# Altium schematic sheet Top_Sheet.SchDoc
size A4; DocumentNumber: 1; SheetNumber: 1; SheetTotal: 28
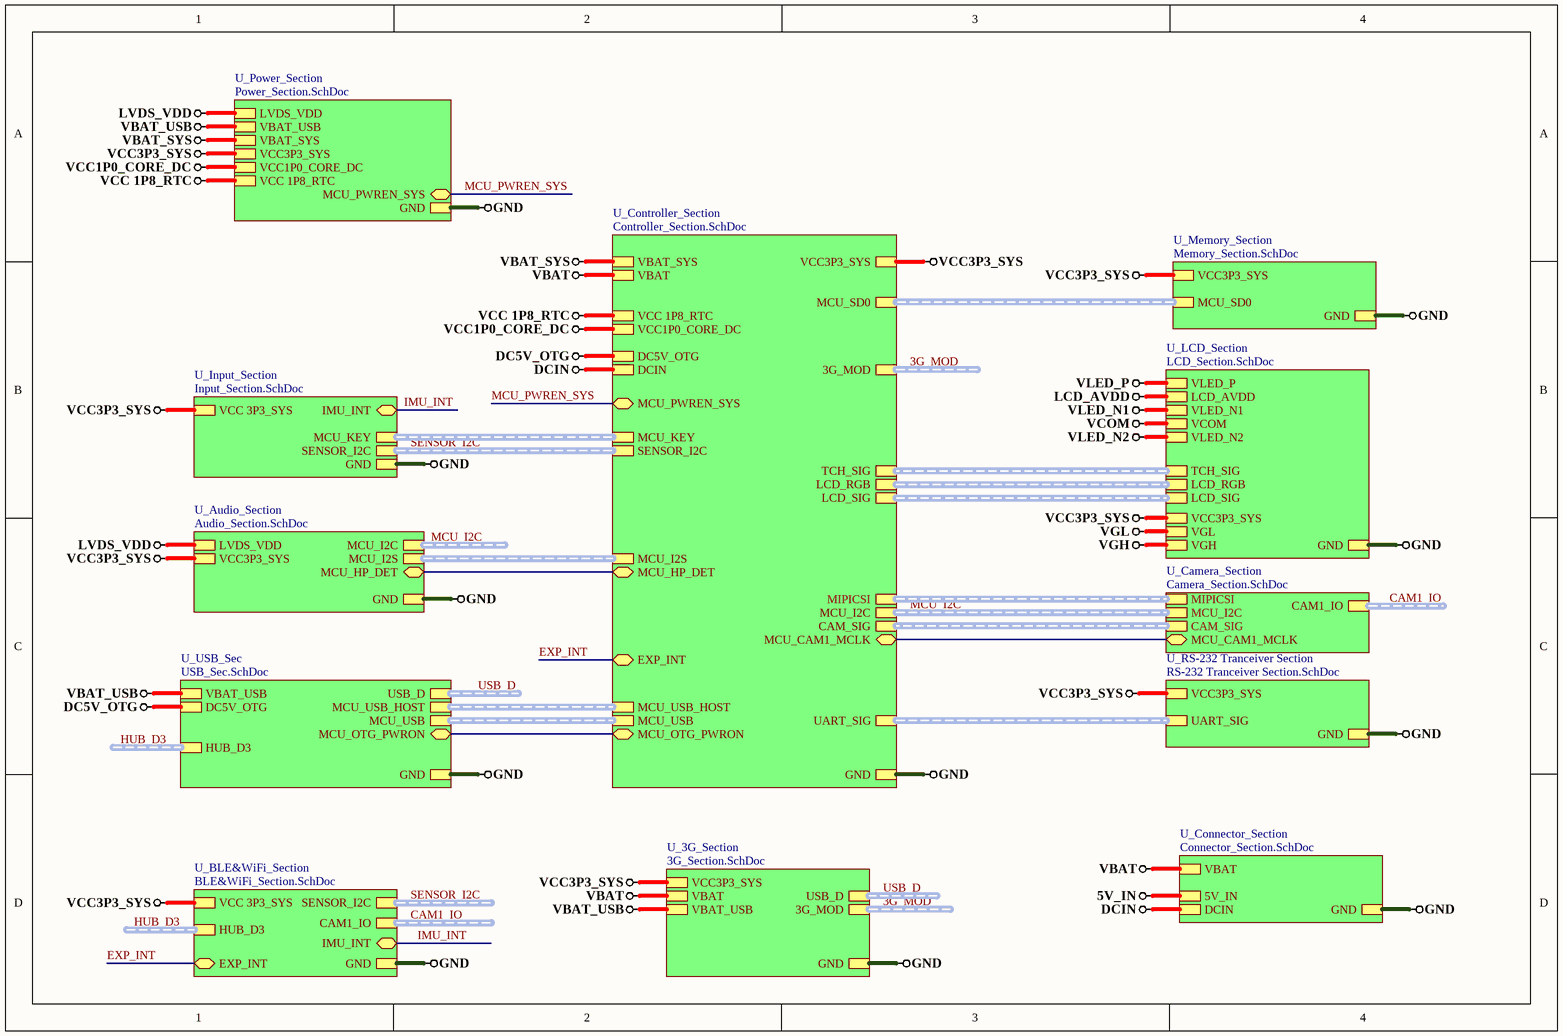
[diagram p0: Top_Sheet.SchDoc]

## Sub-sheets
U_3G_Section = 3G_Section.SchDoc: USB_D (harness USB_D), GND, VCC3P3_SYS, VBAT, VBAT_USB, 3G_MOD (harness 3G_MOD)
U_Audio_Section = Audio_Section.SchDoc: MCU_I2S (harness MCU_I2S), MCU_HP_DET (bidir), LVDS_VDD, VCC3P3_SYS, GND, MCU_I2C (harness MCU_I2C)
U_BLE&WiFi_Section = BLE&WiFi_Section.SchDoc: HUB_D3 (harness HUB_D3), GND, VCC 3P3_SYS, SENSOR_I2C (harness SENSOR_I2C), CAM1_IO (harness CAM1_IO), EXP_INT (bidir), IMU_INT (bidir)
U_Camera_Section = Camera_Section.SchDoc: MCU_I2C (harness MCU_I2C), CAM_SIG (harness CAM_SIG), MCU_CAM1_MCLK (bidir), MIPICSI (harness MIPICSI), CAM1_IO (harness CAM1_IO)
U_Connector_Section = Connector_Section.SchDoc: GND, VBAT, 5V_IN, DCIN
U_Controller_Section = Controller_Section.SchDoc: MCU_HP_DET (bidir), TCH_SIG (harness TCH_SIG), MCU_KEY (harness MCU_KEY), MCU_USB (harness MCU_USB), MCU_SD0 (harness MCU_SD0), MCU_I2C (harness MCU_I2C), MCU_I2S (harness MCU_I2S), CAM_SIG (harness CAM_SIG), MCU_OTG_PWRON (bidir), MCU_CAM1_MCLK (bidir), MCU_USB_HOST (harness MCU_USB_HOST), VCC3P3_SYS, GND, VBAT_SYS, VCC 1P8_RTC, VBAT, VCC1P0_CORE_DC, DC5V_OTG, DCIN, UART_SIG (harness UART_SIG), LCD_RGB (harness LCD_RGB), MCU_PWREN_SYS (bidir), SENSOR_I2C (harness SENSOR_I2C), LCD_SIG (harness LCD_SIG), 3G_MOD (harness 3G_MOD), MIPICSI (harness MIPICSI), EXP_INT (bidir)
U_Input_Section = Input_Section.SchDoc: MCU_KEY (harness MCU_KEY), GND, VCC 3P3_SYS, SENSOR_I2C (harness SENSOR_I2C), IMU_INT (bidir)
U_LCD_Section = LCD_Section.SchDoc: TCH_SIG (harness TCH_SIG), GND, LCD_RGB (harness LCD_RGB), LCD_SIG (harness LCD_SIG), LCD_AVDD, VLED_P, VLED_N1, VCOM, VGL, VGH, VCC3P3_SYS, VLED_N2
U_Memory_Section = Memory_Section.SchDoc: MCU_SD0 (harness MCU_SD0), GND, VCC3P3_SYS
U_Power_Section = Power_Section.SchDoc: GND, LVDS_VDD, VBAT_USB, VBAT_SYS, VCC3P3_SYS, VCC1P0_CORE_DC, VCC 1P8_RTC, MCU_PWREN_SYS (bidir)
U_RS-232 Tranceiver Section = RS-232 Tranceiver Section.SchDoc: GND, VCC3P3_SYS, UART_SIG (harness UART_SIG)
U_USB_Sec = USB_Sec.SchDoc: USB_D (harness USB_D), MCU_USB_HOST (harness MCU_USB_HOST), MCU_USB (harness MCU_USB), MCU_OTG_PWRON (bidir), GND, VBAT_USB, DC5V_OTG, HUB_D3 (harness HUB_D3)

## Nets
5V_IN: sheet U_Connector_Section/5V_IN
DC5V_OTG: sheet U_Controller_Section/DC5V_OTG, sheet U_USB_Sec/DC5V_OTG
DCIN: sheet U_Controller_Section/DCIN, sheet U_Connector_Section/DCIN
GND: sheet U_Controller_Section/GND, sheet U_Power_Section/GND, sheet U_Audio_Section/GND, sheet U_Input_Section/GND, sheet U_USB_Sec/GND, sheet U_Memory_Section/GND, sheet U_LCD_Section/GND, sheet U_Connector_Section/GND, sheet U_3G_Section/GND, sheet U_RS-232 Tranceiver Section/GND, sheet U_BLE&WiFi_Section/GND
LCD_AVDD: sheet U_LCD_Section/LCD_AVDD
LVDS_VDD: sheet U_Power_Section/LVDS_VDD, sheet U_Audio_Section/LVDS_VDD
VBAT: sheet U_Controller_Section/VBAT, sheet U_Connector_Section/VBAT, sheet U_3G_Section/VBAT
VBAT_SYS: sheet U_Controller_Section/VBAT_SYS, sheet U_Power_Section/VBAT_SYS
VBAT_USB: sheet U_Power_Section/VBAT_USB, sheet U_USB_Sec/VBAT_USB, sheet U_3G_Section/VBAT_USB
VCC1P0_CORE_DC: sheet U_Controller_Section/VCC1P0_CORE_DC, sheet U_Power_Section/VCC1P0_CORE_DC
VCC3P3_SYS: sheet U_Controller_Section/VCC3P3_SYS, sheet U_Power_Section/VCC3P3_SYS, sheet U_Audio_Section/VCC3P3_SYS, sheet U_Input_Section/VCC 3P3_SYS, sheet U_Memory_Section/VCC3P3_SYS, sheet U_LCD_Section/VCC3P3_SYS, sheet U_3G_Section/VCC3P3_SYS, sheet U_RS-232 Tranceiver Section/VCC3P3_SYS, sheet U_BLE&WiFi_Section/VCC 3P3_SYS
VCC 1P8_RTC: sheet U_Controller_Section/VCC 1P8_RTC, sheet U_Power_Section/VCC 1P8_RTC
VCOM: sheet U_LCD_Section/VCOM
VGH: sheet U_LCD_Section/VGH
VGL: sheet U_LCD_Section/VGL
VLED_N1: sheet U_LCD_Section/VLED_N1
VLED_N2: sheet U_LCD_Section/VLED_N2
VLED_P: sheet U_LCD_Section/VLED_P
EXP_INT: sheet U_Controller_Section/EXP_INT, sheet U_BLE&WiFi_Section/EXP_INT
IMU_INT: sheet U_Input_Section/IMU_INT, sheet U_BLE&WiFi_Section/IMU_INT
MCU_PWREN_SYS: sheet U_Controller_Section/MCU_PWREN_SYS, sheet U_Power_Section/MCU_PWREN_SYS
(unnamed): sheet U_Controller_Section/MCU_HP_DET, sheet U_Audio_Section/MCU_HP_DET
(unnamed): sheet U_Controller_Section/MCU_OTG_PWRON, sheet U_USB_Sec/MCU_OTG_PWRON
(unnamed): sheet U_Controller_Section/MCU_CAM1_MCLK, sheet U_Camera_Section/MCU_CAM1_MCLK

## Buses and harness runs
harness 3G_MOD = sheet U_3G_Section/3G_MOD
harness 3G_MOD = sheet U_Controller_Section/3G_MOD
harness CAM1_IO = sheet U_BLE&WiFi_Section/CAM1_IO
harness CAM1_IO = sheet U_Camera_Section/CAM1_IO
harness HUB_D3 = sheet U_BLE&WiFi_Section/HUB_D3
harness HUB_D3 = sheet U_USB_Sec/HUB_D3
harness MCU_I2C = sheet U_Audio_Section/MCU_I2C
harness MCU_I2C = sheet U_Camera_Section/MCU_I2C = sheet U_Controller_Section/MCU_I2C
harness SENSOR_I2C = sheet U_BLE&WiFi_Section/SENSOR_I2C
harness SENSOR_I2C = sheet U_Controller_Section/SENSOR_I2C = sheet U_Input_Section/SENSOR_I2C
harness sheet U_Audio_Section/MCU_I2S = sheet U_Controller_Section/MCU_I2S
harness sheet U_Camera_Section/CAM_SIG = sheet U_Controller_Section/CAM_SIG
harness sheet U_Camera_Section/MIPICSI = sheet U_Controller_Section/MIPICSI
harness sheet U_Controller_Section/LCD_RGB = sheet U_LCD_Section/LCD_RGB
harness sheet U_Controller_Section/LCD_SIG = sheet U_LCD_Section/LCD_SIG
harness sheet U_Controller_Section/MCU_KEY = sheet U_Input_Section/MCU_KEY
harness sheet U_Controller_Section/MCU_SD0 = sheet U_Memory_Section/MCU_SD0
harness sheet U_Controller_Section/MCU_USB = sheet U_USB_Sec/MCU_USB
harness sheet U_Controller_Section/MCU_USB_HOST = sheet U_USB_Sec/MCU_USB_HOST
harness sheet U_Controller_Section/TCH_SIG = sheet U_LCD_Section/TCH_SIG
harness sheet U_Controller_Section/UART_SIG = sheet U_RS-232 Tranceiver Section/UART_SIG
harness USB_D = sheet U_3G_Section/USB_D
harness USB_D = sheet U_USB_Sec/USB_D